# Altium schematic sheet LowSideSwitches.SchDoc: Acionamentos auxiliares
size 420 x 297 mm; Author: Matheus Markies; DrawnBy: Matheus Markies; Engineer: Matheus Markies; DocumentNumber: ECTU-SCH-06; Revision: A definir; SheetNumber: 6; SheetTotal: 12; ProjectTitle: ROUTE ECU / ECTU; DocumentStatus: Em desenvolvimento; DocumentDate: 14/10/2026
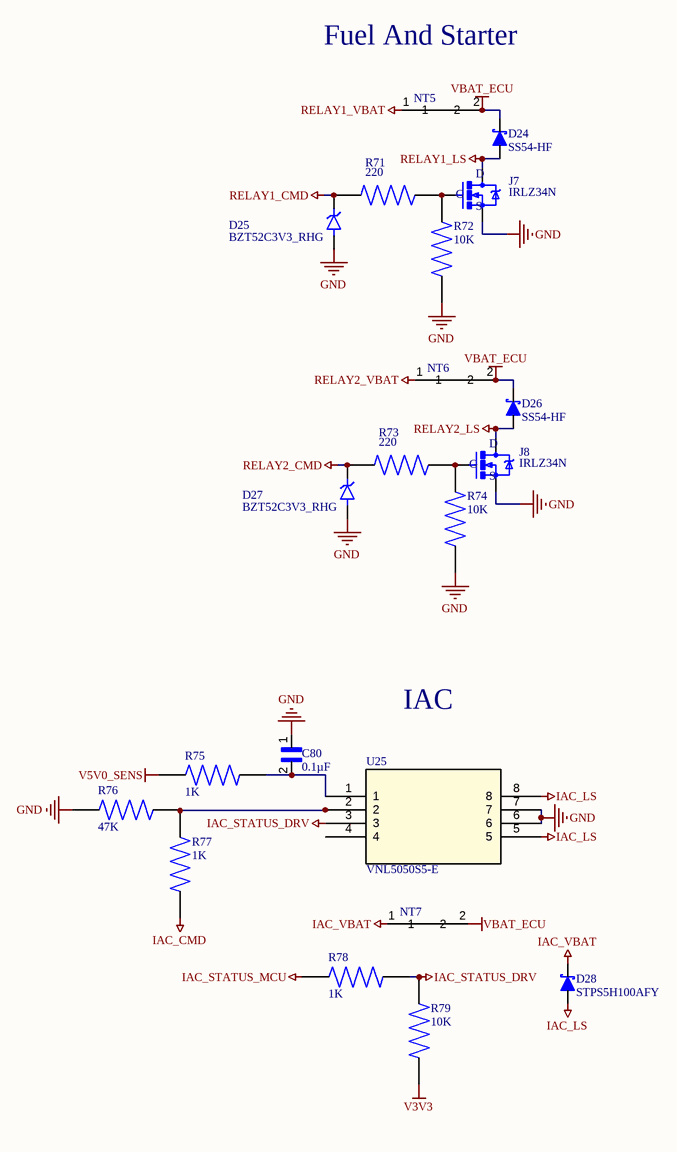
[diagram p0: LowSideSwitches.SchDoc]

## Parts
C80  0.1µF  [CAPC1608X90N]
D24  SS54-HF  [DIOM5025X220N]
D25  BZT52C3V3_RHG  [DIO_BZT52C3V3_RHG]
D26  SS54-HF  [DIOM5025X220N]
D27  BZT52C3V3_RHG  [DIO_BZT52C3V3_RHG]
D28  STPS5H100AFY  [DIOM5025X220N]
J7  IRLZ34N  [TO-220(2)]
J8  IRLZ34N  [TO-220(2)]
NT5  NT  [NetTie]  (value not drawn)  (net tie, no BOM)
NT6  NT  [NetTie]  (value not drawn)  (net tie, no BOM)
NT7  NT  [NetTie]  (value not drawn)  (net tie, no BOM)
R71  220  [RESC3116X65N]
R72  10K  [RESC3116X65N]
R73  220  [RESC3116X65N]
R74  10K  [RESC3116X65N]
R75  1K  [RESC3116X65N]
R76  47K  [RESC3116X65N]
R77  1K  [RESC3116X65N]
R78  1K  [RESC3116X65N]
R79  10K  [RESC3116X65N]
U25  VNL5050S5-E  [SO-8_STM]

## Nets
GND: C80.1 D25.A D27.A J7.OUT(S) J8.OUT(S) R72.2 R74.2 R76.2 U25.6 U25.7
IAC_CMD: R77.1
IAC_LS: D28.2(A) U25.5 U25.8
IAC_STATUS_DRV: R78.2 R79.1 U25.3
IAC_STATUS_MCU: R78.1
IAC_VBAT: D28.1(K) NT7.1
RELAY1_CMD: D25.C(K) R71.1
RELAY1_LS: D24.2(A) J7.GND(D)
RELAY1_VBAT: NT5.1
RELAY2_CMD: D27.C(K) R73.1
RELAY2_LS: D26.2(A) J8.GND(D)
RELAY2_VBAT: NT6.1
V3V3: R79.2
V5V0_SENS: R75.1
VBAT_ECU: D24.1(K) D26.1(K) NT5.2 NT6.2 NT7.2
NetC80_2: C80.2 R75.2 U25.1
NetJ7_IN: J7.IN(G) R71.2 R72.1
NetJ8_IN: J8.IN(G) R73.2 R74.1
NetR76_1: R76.1 R77.2 U25.2

Not connected (* = marked no-connect by the designer): U25 4

## Notes on the sheet
- Fuel And Starter
- IAC
- PROJETO
- STATUS
- FOLHA / SUBSISTEMA
- AUTOR
- CÓDIGO DO DESENHO
- ARQUIVO
- ATUALIZAÇÃO
- REVISÃO
- FOLHA
- FORMATO
- A3
- /

## Library data of the parts
C80 = 06035C104MAZ2A: Multilayer Ceramic Capacitors MLCC - SMD/SMT; Package: None; Price: None; Value: *; MP: 06035C104MAZ2A; Availability: Unavailable
D24 D26 D28 = SS54-HF: Diode Schottky 40 V 5A Surface Mount DO-214AC (SMA); MF: Comchip Technology; SnapEDA_Link: https://www.snapeda.com/parts/SS54-HF/Comchip/view-part/?ref=snap; Package: DO-214AC-214 Comchip Technology; Value: *; MP: SS54-HF; Check_prices: https://www.snapeda.com/parts/SS54-HF/Comchip/view-part/?ref=eda
J7 J8 = IRLZ34N: N-Channel 55 V 30A (Tc) 3.8W (Ta), 68W (Tc) Surface Mount D2PAK; MF: Infineon; SnapEDA_Link: https://www.snapeda.com/parts/IRLZ34N/Infineon/view-part/?ref=snap; Package: TO-220 Infineon; Value: *; MP: IRLZ34N; Check_prices: https://www.snapeda.com/parts/IRLZ34N/Infineon/view-part/?ref=eda
R71-R79 = AA1206JR-07470RL: Package: None; Price: None; Value: *; MP: AA1206JR-07470RL; Availability: Unavailable
U25 = VNL5050S5-E: OMNIFET III fully protected low-side driver; Manufacturer_Name: STMicroelectronics; Copyright: Copyright (C) 2026 Ultra Librarian. All rights reserved.; Manufacturer_Part_Number: VNL5050S5-E; Datasheet: https://www.st.com/resource/en/datasheet/vnl5050n3-e.pdf; RefDes: RefDes; Type: Type
D25 D27 = BZT52C3V3_RHG: Package: None; Price: None; Value: *; MP: BZT52C3V3_RHG; Availability: Unavailable